# Altium schematic sheet FPGA_Power.SchDoc
size A4; SheetNumber: 11; SheetTotal: 13
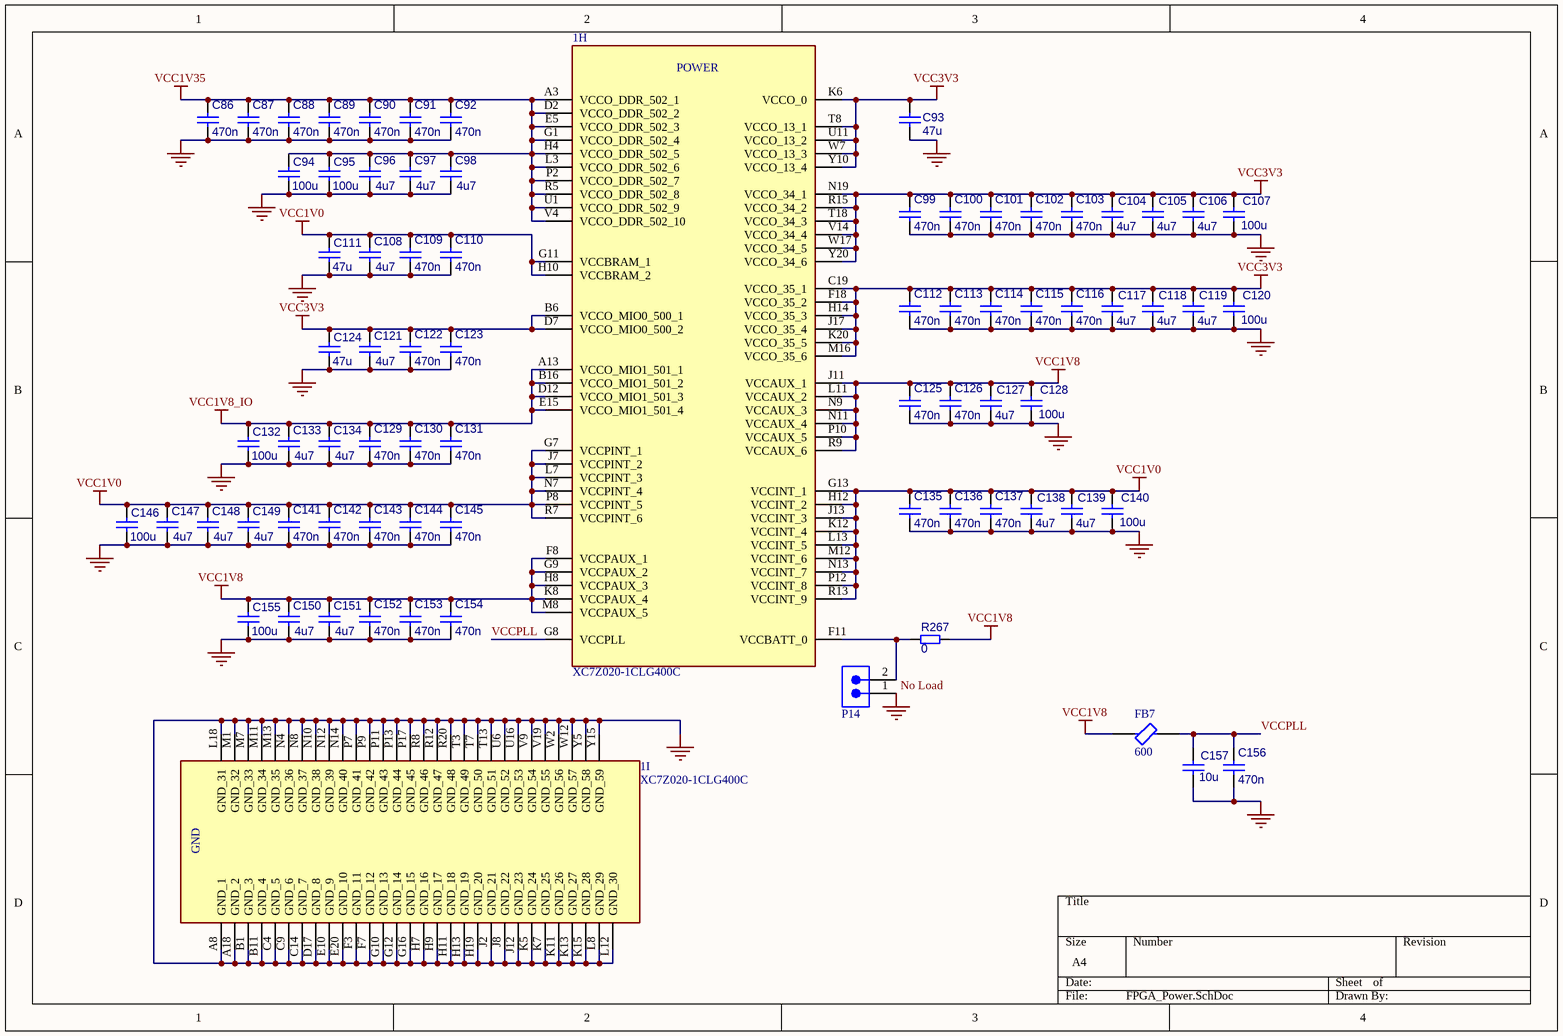
[diagram p0: FPGA_Power.SchDoc]

## Parts
1  XC7Z020-1CLG400C  [BGA400C80P20X20_1700X1700X160]  (parts H,I of 9)
C86  470n  [CAPC1005X50N_0402]
C87  470n  [CAPC1005X50N_0402]
C88  470n  [CAPC1005X50N_0402]
C89  470n  [CAPC1005X50N_0402]
C90  470n  [CAPC1005X50N_0402]
C91  470n  [CAPC1005X50N_0402]
C92  470n  [CAPC1005X50N_0402]
C93  47u  [C_1210]
C94  100u  [C_1210]
C95  100u  [C_1210]
C96  4u7  [C_0805]
C97  4u7  [C_0805]
C98  4u7  [C_0805]
C99  470n  [CAPC1005X50N_0402]
C100  470n  [CAPC1005X50N_0402]
C101  470n  [CAPC1005X50N_0402]
C102  470n  [CAPC1005X50N_0402]
C103  470n  [CAPC1005X50N_0402]
C104  4u7  [C_0805]
C105  4u7  [C_0805]
C106  4u7  [C_0805]
C107  100u  [C_1210]
C108  4u7  [C_0805]
C109  470n  [CAPC1005X50N_0402]
C110  470n  [CAPC1005X50N_0402]
C111  47u  [C_1210]
C112  470n  [CAPC1005X50N_0402]
C113  470n  [CAPC1005X50N_0402]
C114  470n  [CAPC1005X50N_0402]
C115  470n  [CAPC1005X50N_0402]
C116  470n  [CAPC1005X50N_0402]
C117  4u7  [C_0805]
C118  4u7  [C_0805]
C119  4u7  [C_0805]
C120  100u  [C_1210]
C121  4u7  [C_0805]
C122  470n  [CAPC1005X50N_0402]
C123  470n  [CAPC1005X50N_0402]
C124  47u  [C_1210]
C125  470n  [CAPC1005X50N_0402]
C126  470n  [CAPC1005X50N_0402]
C127  4u7  [C_0805]
C128  100u  [C_1210]
C129  470n  [CAPC1005X50N_0402]
C130  470n  [CAPC1005X50N_0402]
C131  470n  [CAPC1005X50N_0402]
C132  100u  [C_1210]
C133  4u7  [C_0805]
C134  4u7  [C_0805]
C135  470n  [CAPC1005X50N_0402]
C136  470n  [CAPC1005X50N_0402]
C137  470n  [CAPC1005X50N_0402]
C138  4u7  [C_0805]
C139  4u7  [C_0805]
C140  100u  [C_1210]
C141  470n  [CAPC1005X50N_0402]
C142  470n  [CAPC1005X50N_0402]
C143  470n  [CAPC1005X50N_0402]
C144  470n  [CAPC1005X50N_0402]
C145  470n  [CAPC1005X50N_0402]
C146  100u  [C_1210]
C147  4u7  [C_0805]
C148  4u7  [C_0805]
C149  4u7  [C_0805]
C150  4u7  [C_0805]
C151  4u7  [C_0805]
C152  470n  [CAPC1005X50N_0402]
C153  470n  [CAPC1005X50N_0402]
C154  470n  [CAPC1005X50N_0402]
C155  100u  [C_1210]
C156  470n  [CAPC1005X50N_0402]
C157  10u  [C_0805]
FB7  600  [FP-BLM31-0_2-t1_6-IPC_A]
P14  Male Pin Header 2x1 2.54mm  [Copy of Copy of Copy of Copy of 3M-2340-6111TG_V]  (value not drawn)
R267  0  [R_0402]

## Nets
GND: 1.A8(GND_1) 1.A18(GND_2) 1.B1(GND_3) 1.B11(GND_4) 1.C4(GND_5) 1.C9(GND_6) 1.C14(GND_7) 1.D17(GND_8) 1.E10(GND_9) 1.E20(GND_10) 1.F3(GND_11) 1.F7(GND_12) 1.G10(GND_13) 1.G12(GND_14) 1.G16(GND_15) 1.H7(GND_16) 1.H9(GND_17) 1.H11(GND_18) 1.H13(GND_19) 1.H19(GND_20) 1.J2(GND_21) 1.J8(GND_22) 1.J12(GND_23) 1.K5(GND_24) 1.K7(GND_25) 1.K11(GND_26) 1.K13(GND_27) 1.K15(GND_28) 1.L8(GND_29) 1.L12(GND_30) 1.L18(GND_31) 1.M1(GND_32) 1.M7(GND_33) 1.M11(GND_34) 1.M13(GND_35) 1.N4(GND_36) 1.N8(GND_37) 1.N10(GND_38) 1.N12(GND_39) 1.N14(GND_40) 1.P7(GND_41) 1.P9(GND_42) 1.P11(GND_43) 1.P13(GND_44) 1.P17(GND_45) 1.R8(GND_46) 1.R12(GND_47) 1.R20(GND_48) 1.T3(GND_49) 1.T7(GND_50) 1.T13(GND_51) 1.U6(GND_52) 1.U16(GND_53) 1.V9(GND_54) 1.V19(GND_55) 1.W2(GND_56) 1.W12(GND_57) 1.Y5(GND_58) 1.Y15(GND_59) C86.1 C87.1 C88.1 C89.1 C90.1 C91.1 C92.1 C93.2 C94.2 C95.2 C96.1 C97.1 C98.1 C99.1 C100.1 C101.1 C102.1 C103.1 C104.1 C105.1 C106.1 C107.2 C108.1 C109.1 C110.1 C111.2 C112.1 C113.1 C114.1 C115.1 C116.1 C117.1 C118.1 C119.1 C120.2 C121.1 C122.1 C123.1 C124.2 C125.1 C126.1 C127.1 C128.2 C129.1 C130.1 C131.1 C132.2 C133.1 C134.1 C135.1 C136.1 C137.1 C138.1 C139.1 C140.2 C141.1 C142.1 C143.1 C144.1 C145.1 C146.2 C147.1 C148.1 C149.1 C150.1 C151.1 C152.1 C153.1 C154.1 C155.2 C156.1 C157.1 P14.1
VCC1V0: 1.G7(VCCPINT_1) 1.G11(VCCBRAM_1) 1.G13(VCCINT_1) 1.H10(VCCBRAM_2) 1.H12(VCCINT_2) 1.J7(VCCPINT_2) 1.J13(VCCINT_3) 1.K12(VCCINT_4) 1.L7(VCCPINT_3) 1.L13(VCCINT_5) 1.M12(VCCINT_6) 1.N7(VCCPINT_4) 1.N13(VCCINT_7) 1.P8(VCCPINT_5) 1.P12(VCCINT_8) 1.R7(VCCPINT_6) 1.R13(VCCINT_9) C108.2 C109.2 C110.2 C111.1 C135.2 C136.2 C137.2 C138.2 C139.2 C140.1 C141.2 C142.2 C143.2 C144.2 C145.2 C146.1 C147.2 C148.2 C149.2
VCC1V8: 1.F8(VCCPAUX_1) 1.G9(VCCPAUX_2) 1.H8(VCCPAUX_3) 1.J11(VCCAUX_1) 1.K8(VCCPAUX_4) 1.L11(VCCAUX_2) 1.M8(VCCPAUX_5) 1.N9(VCCAUX_3) 1.N11(VCCAUX_4) 1.P10(VCCAUX_5) 1.R9(VCCAUX_6) C125.2 C126.2 C127.2 C128.1 C150.2 C151.2 C152.2 C153.2 C154.2 C155.1 FB7.1 R267.2
VCC1V8_IO: 1.A13(VCCO_MIO1_501_1) 1.B16(VCCO_MIO1_501_2) 1.D12(VCCO_MIO1_501_3) 1.E15(VCCO_MIO1_501_4) C129.2 C130.2 C131.2 C132.1 C133.2 C134.2
VCC1V35: 1.A3(VCCO_DDR_502_1) 1.D2(VCCO_DDR_502_2) 1.E5(VCCO_DDR_502_3) 1.G1(VCCO_DDR_502_4) 1.H4(VCCO_DDR_502_5) 1.L3(VCCO_DDR_502_6) 1.P2(VCCO_DDR_502_7) 1.R5(VCCO_DDR_502_8) 1.U1(VCCO_DDR_502_9) 1.V4(VCCO_DDR_502_10) C86.2 C87.2 C88.2 C89.2 C90.2 C91.2 C92.2 C94.1 C95.1 C96.2 C97.2 C98.2
VCC3V3: 1.B6(VCCO_MIO0_500_1) 1.C19(VCCO_35_1) 1.D7(VCCO_MIO0_500_2) 1.F18(VCCO_35_2) 1.H14(VCCO_35_3) 1.J17(VCCO_35_4) 1.K6(VCCO_0) 1.K20(VCCO_35_5) 1.M16(VCCO_35_6) 1.N19(VCCO_34_1) 1.R15(VCCO_34_2) 1.T8(VCCO_13_1) 1.T18(VCCO_34_3) 1.U11(VCCO_13_2) 1.V14(VCCO_34_4) 1.W7(VCCO_13_3) 1.W17(VCCO_34_5) 1.Y10(VCCO_13_4) 1.Y20(VCCO_34_6) C93.1 C99.2 C100.2 C101.2 C102.2 C103.2 C104.2 C105.2 C106.2 C107.1 C112.2 C113.2 C114.2 C115.2 C116.2 C117.2 C118.2 C119.2 C120.1 C121.2 C122.2 C123.2 C124.1
VCCPLL: 1.G8(VCCPLL) C156.2 C157.2 FB7.2
Net1_F11: 1.F11(VCCBATT_0) P14.2 R267.1

## Notes on the sheet
- No Load
- (in symbol XC7Z020-1CLG400C, part H) POWER
- (in symbol XC7Z020-1CLG400C, part I) GND

## Library data of the parts
1 = XC7Z020-1CLG400C: Integrated Circuit; Manufacturer_Name: AMD; Datasheet Link: http://www.xilinx.com/support/documentation/data_sheets/ds190-Zynq-7000-Overview.pdf; Height: 1.6mm; Manufacturer_Part_Number: XC7Z020-1CLG400C; Mouser Part Number: 217-XC7Z020-1CLG400C; Mouser Price/Stock: https://www.mouser.co.uk/ProductDetail/AMD-Xilinx/XC7Z020-1CLG400C?qs=rrS6PyfT74eaxuOsP%2FGL4g%3D%3D
C86-C92 C99-C103 C109 C110 C112-C116 C122 C123 C125 C126 C129-C131 C135-C137 C141-C145 C152-C154 C156 = CMP-001-00084-2: MLCC 0402
C93-C95 C107 C111 C120 C124 C128 C132 C140 C146 C155 = CMP-001-00088-1: 1210, X5R:EIA, 100uF, DC6.3V, GRM32ER60J107ME20
C96-C98 C104-C106 C108 C117-C119 C121 C127 C133 C134 C138 C139 C147-C151 C157 = CMP-001-00086-2: MLCC 0805
FB7 = CMP-06046-002432-1: Chip Ferrite Bead, 1206, 600Ω @ 100MHz, 0.038Ω, 25%, 2.9A; Number of Lines: 1; DC Resistance (DCR): 38mR; Max Operating Temperature: 125°C; Packaging: Cut Tape; Min Operating Temperature: -55°C; Mount: Surface Mount; Case Code (Metric): 3216; Case/Package: 1206; Case Code (Imperial): 1206; Max Current Rating: 2.9A
P14 = CMP-002-00078-1: Male Header, Pitch 2.54 mm, 2x 1 Position, Height 8.636 mm, Tail Length 3.05 mm, -55 to 105 degC, RoHS, Bulk; Manufacturer: 3M; Max Current Rating: 3A; Rows: 1; Gender: Male; Max Operating Temperature: 105°C; Contact Finish: Gold; Datasheet URL: https://datasheet.ciiva.com/5161/ts0766-242217-5161112.pdf; Pins: 40; Package Description: Male Header, Pitch 2.54 mm, 1 x 40 Position, Height 8.636 mm, Tail Length 3.05 mm; Contact Material: Copper; Package Reference: 2340-6111TG; Package Quantity: 200; Current Rating: 3A; Datasheet Version: Aug-08; Min Operating Temperature: -55°C; Connector Type: Header; Contact Plating: Gold; Case/Package: 2340-6111TG; Packaging: Bulk; RoHS Compliant: True; Manufacturer URL: http://www.3m.com/; Lead Pitch: 0.1inch; Colour: Black; Mounting Technology: TH
R267 = CMP-009-00178-3: Chip 0402 resistor